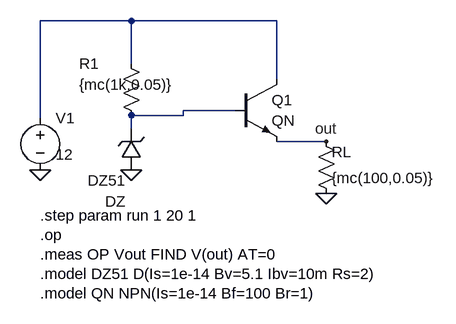
[diagram p0: schematic Ex11.asc]
Ex11.asc, the LTspice schematic file:
Version 4
SHEET 1 880 680
WIRE 60 200 60 50
WIRE 60 50 200 50
WIRE 200 50 200 116
WIRE 200 50 424 50
WIRE 424 50 424 140
WIRE 200 196 200 216
WIRE 200 196 280 196
WIRE 280 196 280 188
WIRE 280 188 360 188
WIRE 424 236 500 236
FLAG 500 236 out
FLAG 60 280 0
FLAG 200 280 0
FLAG 500 316 0
SYMBOL voltage 60 184 R0
WINDOW 0 24 16 Left 2
WINDOW 3 24 72 Left 2
SYMATTR InstName V1
SYMATTR Value 12
SYMBOL res 184 100 R0
WINDOW 0 -64 16 Left 2
WINDOW 3 -64 48 Left 2
SYMATTR InstName R1
SYMATTR Value {mc(1k,0.05)}
SYMBOL zener 216 280 R180
WINDOW 0 24 -48 Left 2
WINDOW 3 24 -16 Left 2
SYMATTR InstName DZ
SYMATTR Value DZ51
SYMBOL npn 360 140 R0
WINDOW 0 56 32 Left 2
WINDOW 3 56 64 Left 2
SYMATTR InstName Q1
SYMATTR Value QN
SYMBOL res 484 220 R0
WINDOW 0 24 32 Left 2
WINDOW 3 24 72 Left 2
SYMATTR InstName RL
SYMATTR Value {mc(100,0.05)}
TEXT 60 350 Left 2 !.step param run 1 20 1
TEXT 60 380 Left 2 !.op
TEXT 60 410 Left 2 !.meas OP Vout FIND V(out) AT=0
TEXT 60 440 Left 2 !.model DZ51 D(Is=1e-14 Bv=5.1 Ibv=10m Rs=2)
TEXT 60 470 Left 2 !.model QN NPN(Is=1e-14 Bf=100 Br=1)

The netlist it stands for:
* Ex11.asc
V1 N001 0 12
R1 N001 N002 {mc(1k,0.05)}
DZ 0 N002 DZ51
Q1 N001 N002 out 0 QN
RL out 0 {mc(100,0.05)}
.model D D
.lib standard.dio
.model NPN NPN
.model PNP PNP
.lib standard.bjt
.step param run 1 20 1
.op
.meas OP Vout FIND V(out) AT=0
.model DZ51 D(Is=1e-14 Bv=5.1 Ibv=10m Rs=2)
.model QN NPN(Is=1e-14 Bf=100 Br=1)
.backanno
.end

* Results of the author's LTspice run, read from the files saved beside the schematic
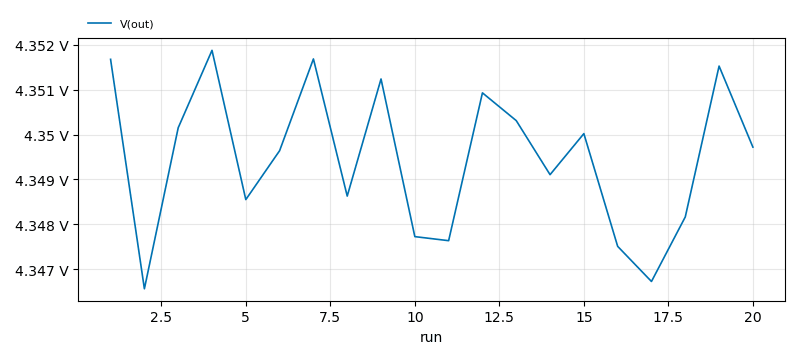
[diagram p1: Operating Point of Ex11.asc, plotted from the saved traces]
* Operating Point, 1 run:
*   V(out): 4.352 V at run=1 , 4.35 V at run=20 , min 4.347 V, max 4.352 V